# EAGLE design queencontroller2022 (EAGLE 9.6.2)

## Sheet 1 of 2
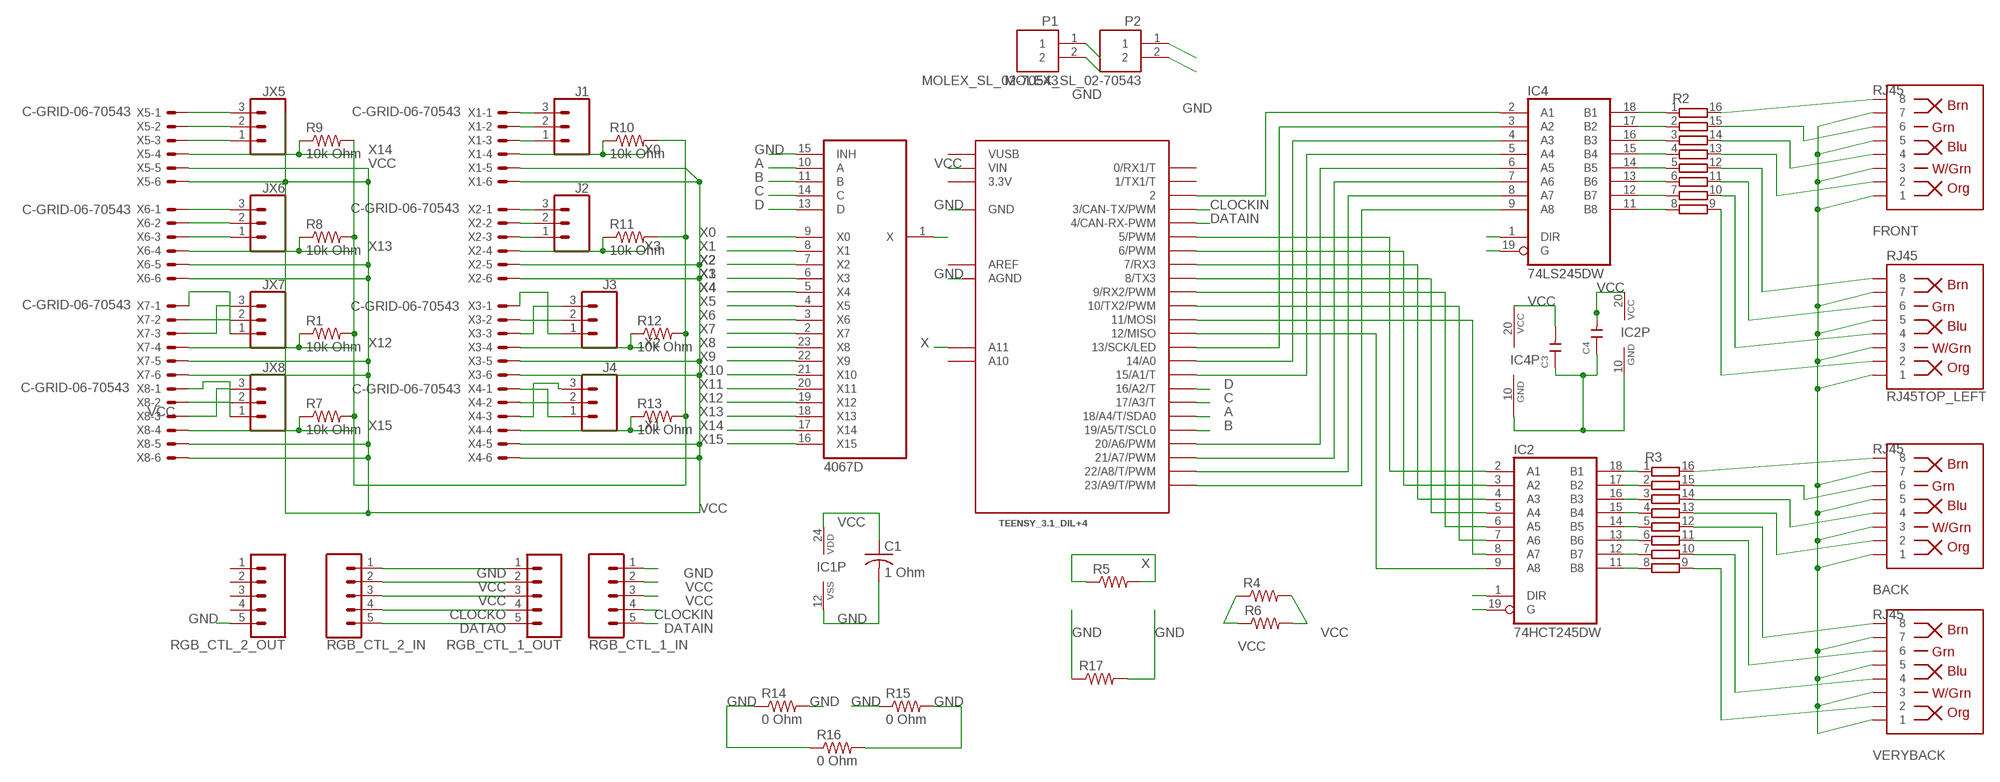
[diagram p0: schematic, sheet 1]

### Parts
BACK  RJ45  RJ45-8  [RJ45-8]
C1  1 Ohm  C-USC1206  [C1206]
C3  CAP-1206  [C1206]
C4  CAP-1206  [C1206]
FRONT  RJ45  RJ45-8  [RJ45-8]
IC1  4067D  [SO24W]
IC2  74HCT245DW  [SO20W]
IC4  74LS245DW  [SO20W]
J1  CONN_03  [1X03]
J2  CONN_03  [1X03]
J3  CONN_03  [1X03]
J4  CONN_03  [1X03]
JX5  CONN_03  [1X03]
JX6  CONN_03  [1X03]
JX7  CONN_03  [1X03]
JX8  CONN_03  [1X03]
P1  MOLEX_SL_02-70543  [SL_70543_2]
P2  MOLEX_SL_02-70543  [SL_70543_2]
R1  10k Ohm  R-US_M1206  [M1206]
R2  4816P-T01  [4816P]
R3  4816P-T01  [4816P]
R4  R-US_R2512  [R2512]
R5  R-US_R2512  [R2512]
R6  R-US_R2512  [R2512]
R7  10k Ohm  R-US_M1206  [M1206]
R8  10k Ohm  R-US_M1206  [M1206]
R9  10k Ohm  R-US_M1206  [M1206]
R10  10k Ohm  R-US_M1206  [M1206]
R11  10k Ohm  R-US_M1206  [M1206]
R12  10k Ohm  R-US_M1206  [M1206]
R13  10k Ohm  R-US_M1206  [M1206]
R14  0 Ohm  R-US_R2512  [R2512]
R15  0 Ohm  R-US_R2512  [R2512]
R16  0 Ohm  R-US_M1206  [M1206]
R17  R-US_R2512  [R2512]
RGB_CTL_1_IN  CONN_05  [1X05]
RGB_CTL_1_OUT  CONN_05  [1X05]
RGB_CTL_2_IN  CONN_05  [1X05]
RGB_CTL_2_OUT  CONN_05  [1X05]
RJ45TOP_LEFT  RJ45  RJ45-8  [RJ45-8]
U$3  TEENSY_3.1_DIL+4  [TEENSY3-DIL+4]
VERYBACK  RJ45  RJ45-8  [RJ45-8]
X1  C-GRID-06-70543  [70543-06]
X2  C-GRID-06-70543  [70543-06]
X3  C-GRID-06-70543  [70543-06]
X4  C-GRID-06-70543  [70543-06]
X5  C-GRID-06-70543  [70543-06]
X6  C-GRID-06-70543  [70543-06]
X7  C-GRID-06-70543  [70543-06]
X8  C-GRID-06-70543  [70543-06]

### Nets
A: IC1.10(A) U$3.18/A4(18/A4/T/SDA0)
B: IC1.11(B) U$3.19/A5(19/A5/T/SCL0)
C: IC1.14(C) U$3.17/A3(17/A3/T)
CLOCKIN: RGB_CTL_1_IN.4 U$3.3(3/CAN-TX/PWM)
CLOCKO: RGB_CTL_1_OUT.4 RGB_CTL_2_IN.4
D: IC1.13(D) U$3.16/A2(16/A2/T)
DATAIN: RGB_CTL_1_IN.5 U$3.4(4/CAN-RX-PWM)
DATAO: RGB_CTL_1_OUT.5 RGB_CTL_2_IN.5
GND [power]: BACK.1 BACK.3 BACK.5 BACK.7 C1.2 C3.1 C4.1 FRONT.1 FRONT.3 FRONT.5 FRONT.7 IC1.12(VSS) IC1.15(INH) IC2.10(GND) IC2.19(G) IC4.10(GND) IC4.19(G) P1.2 P2.2 R1.2 R7.2 R8.2 R9.2 R10.2 R11.2 R12.2 R13.2 R14.1 R14.2 R15.1 R15.2 R16.1 R16.2 R17.1 R17.2 RGB_CTL_1_IN.1 RGB_CTL_1_OUT.1 RGB_CTL_2_IN.1 RGB_CTL_2_OUT.5 RJ45TOP_LEFT.1 RJ45TOP_LEFT.3 RJ45TOP_LEFT.5 RJ45TOP_LEFT.7 U$3.AGND U$3.GND VERYBACK.1 VERYBACK.3 VERYBACK.5 VERYBACK.7
N$1: FRONT.8 R2.16
N$2: FRONT.6 R2.15
N$3: FRONT.4 R2.14
N$4: FRONT.2 R2.13
N$5: R2.10 RJ45TOP_LEFT.4
N$6: IC2.18(B1) R3.1
N$7: R2.12 RJ45TOP_LEFT.8
N$8: IC4.18(B1) R2.1
N$9: BACK.8 R3.16
N$10: BACK.6 R3.15
N$11: BACK.4 R3.14
N$12: BACK.2 R3.13
N$13: J3.3 X3.3
N$14: R3.11 VERYBACK.6
N$15: R3.10 VERYBACK.4
N$16: R3.9 VERYBACK.2
N$17: IC4.9(A8) U$3.23/A9(23/A9/T/PWM)
N$18: IC2.9(A8) U$3.12(12/MISO)
N$19: IC2.2(A1) U$3.5(5/PWM)
N$20: IC2.3(A2) U$3.6(6/PWM)
N$21: IC2.4(A3) U$3.7(7/RX3)
N$22: IC2.5(A4) U$3.8(8/TX3)
N$23: IC2.6(A5) U$3.9(9/RX2/PWM)
N$24: IC2.7(A6) U$3.10(10/TX2/PWM)
N$25: IC2.8(A7) U$3.11(11/MOSI)
N$26: IC4.8(A7) U$3.22/A8(22/A8/T/PWM)
N$27: IC4.7(A6) U$3.21/A7(21/A7/PWM)
N$28: IC4.6(A5) U$3.20/A6(20/A6/PWM)
N$29: IC4.5(A4) U$3.15/A1(15/A1/T)
N$30: IC4.4(A3) U$3.14/A0
N$31: IC4.3(A2) U$3.13(13/SCK/LED)
N$32: IC4.2(A1) U$3.2
N$33: IC4.17(B2) R2.2
N$34: IC4.16(B3) R2.3
N$35: IC4.15(B4) R2.4
N$36: IC4.14(B5) R2.5
N$37: IC4.13(B6) R2.6
N$38: IC4.12(B7) R2.7
N$39: IC4.11(B8) R2.8
N$40: R2.9 RJ45TOP_LEFT.2
N$41: IC2.17(B2) R3.2
N$42: IC2.16(B3) R3.3
N$43: IC2.15(B4) R3.4
N$44: IC2.14(B5) R3.5
N$45: IC2.13(B6) R3.6
N$46: IC2.12(B7) R3.7
N$47: IC2.11(B8) R3.8
N$48: J3.1 X3.1
N$49: JX5.3 X5.1
N$50: JX5.2 X5.2
N$51: JX5.1 X5.3
N$52: J4.1 X4.1
N$53: JX6.3 X6.1
N$54: JX6.2 X6.2
N$55: JX6.1 X6.3
N$56: JX7.3 X7.3
N$57: JX7.2 X7.2
N$58: JX7.1 X7.1
N$59: J4.3 X4.3
N$60: JX8.3 X8.3
N$61: JX8.2 X8.2
N$62: JX8.1 X8.1
N$68: R2.11 RJ45TOP_LEFT.6
N$69: R3.12 VERYBACK.8
N$71: J4.2 X4.2
N$76: J3.2 X3.2
N$78: J2.1 X2.3
N$79: J2.2 X2.2
N$81: J2.3 X2.1
N$82: J1.1 X1.3
N$83: J1.2 X1.2
N$84: J1.3 X1.1
VCC [power]: C1.1 C3.2 C4.2 IC1.24(VDD) IC2.1(DIR) IC2.20(VCC) IC4.1(DIR) IC4.20(VCC) P1.1 P2.1 R4.1 R4.2 R6.1 R6.2 RGB_CTL_1_IN.2 RGB_CTL_1_IN.3 RGB_CTL_1_OUT.2 RGB_CTL_1_OUT.3 RGB_CTL_2_IN.2 RGB_CTL_2_IN.3 U$3.VIN X1.5 X1.6 X2.5 X2.6 X3.5 X3.6 X4.5 X4.6 X5.5 X5.6 X6.5 X6.6 X7.5 X7.6 X8.5 X8.6
X: IC1.1(X) R5.1 R5.2 U$3.A11
X0: IC1.9(X0) R10.1 X1.4
X1: IC1.8(X1) R13.1 X4.4
X2: IC1.7(X2) R12.1 X3.4
X3: IC1.6(X3) R11.1 X2.4
X4: IC1.5(X4)
X5: IC1.4(X5)
X6: IC1.3(X6)
X7: IC1.2(X7)
X8: IC1.23(X8)
X9: IC1.22(X9)
X10: IC1.21(X10)
X11: IC1.20(X11)
X12: IC1.19(X12) R1.1 X7.4
X13: IC1.18(X13) R8.1 X6.4
X14: IC1.17(X14) R9.1 X5.4
X15: IC1.16(X15) R7.1 X8.4
Unconnected: RGB_CTL_2_OUT.1 RGB_CTL_2_OUT.2 RGB_CTL_2_OUT.3 RGB_CTL_2_OUT.4 U$3.0(0/RX1/T) U$3.1(1/TX1/T) U$3.A10

## Sheet 2 of 2

## Power pins joined to a net without a drawn wire
3.3V: U$3.3.3V
AREF: U$3.AREF
VUSB: U$3.VUSB

## Library data of the parts
BACK FRONT RJ45TOP_LEFT VERYBACK = SparkFun-Connectors:RJ45-8: RJ45 Jack - 8 pin Simple RJ45, 8-pin connection. Commonly used for Cat5, Cat5e, and Cat6 Ethernet cables. Here is the connector we sell at SparkFun: RJ45 8-Pin Connector <https://www.sparkfun.com/products/643> (PRT-00643) Datasheet <https://cdn.sparkfun.com/datasheets/Prototyping/04908.pdf> It is used on this SparkFun product: SparkFun RJ45 Breakout <https://www.sparkfun.com/products/716> (BOB-00716) Note, you may also be interested in the "MAGJACK" version of this. It is basically a RJ45 connector, but also has some status LEDs built into the connector housing. You can check that out in this library at the device named "MAGJACK.dev" and see these products online: RJ45 Ethernet MagJack-Compatible <https://www.sparkfun.com/products/8534> (PRT-08534) SparkFun RJ45 MagJack Breakout <https://www.sparkfun.com/products/13021> (BOB-13021); PROD_ID: CONN-08506; SF_ID: PRT-00643
C1 = resistor:C-US: CAPACITOR, American symbol
C3 C4 = OPL:CAP: Ceramic Capacitors
IC1 = 40xx:4067: 16-channel ANALOG MULTIPLEXER
IC2 = 74xx-eu:74*245: Octal BUS TRANSCEIVER, 3-state
IC4 = adafruit:74*245: Octal BUS TRANSCEIVER, 3-state
J1-J4 JX5-JX8 = SparkFun-Connectors:CONN_03: Multi connection point. Often used as Generic Header-pin footprint for 0.1 inch spaced/style header connections On any of the 0.1 inch spaced packages, you can populate with these: Break Away Headers - Straight <https://www.sparkfun.com/products/116> (PRT-00116) Break Away Male Headers - Right Angle <https://www.sparkfun.com/products/553> (PRT-00553) Female Headers <https://www.sparkfun.com/products/115> (PRT-00115) Break Away Headers - Machine Pin <https://www.sparkfun.com/products/117> (PRT-00117) Break Away Female Headers - Swiss Machine Pin <https://www.sparkfun.com/products/743> (PRT-00743) Stackable Header - 3 Pin (Female, 0.1") <https://www.sparkfun.com/products/13875> (PRT-13875) For SCREWTERMINALS and SPRING TERMINALS visit here: Screw Terimnals on SparkFun.com <https://www.sparkfun.com/search/results?term=Screw+Terminals> (5mm/3.5mm/2.54mm spacing) This device is also useful as a general connection point to wire up your design to another part of your project. Our various solder wires solder well into these plated through hole pads. Hook-Up Wire - Assortment (Stranded, 22 AWG) <https://www.sparkfun.com/products/11375> (PRT-11375) Hook-Up Wire - Assortment (Solid Core, 22 AWG) <https://www.sparkfun.com/products/11367> (PRT-11367) View the entire wire category on our website here <https://www.sparkfun.com/categories/141> Special notes: Molex polarized connector foot print use with SKU : PRT-08232 with associated crimp pins and housings.
P1 P2 = molex-sl-connectors_jw:MOLEX_SL_02: Molex SL-Series PCB Header, 2-Pos, 0.1" (2.54mm) Centers
R1 R7-R13 = rcl:R-US_: RESISTOR, American symbol; SPICEPREFIX: R
R2 R3 = resistor-bourns:4816P-T01: BOURNS RESISTOR NETWORK; MF: BOURNS, INC.; MPN: 4816P-T01-684LF; OC_FARNELL: 9357483; OC_NEWARK: 33K0707
R4-R6 R14 R15 R17 = resistor:R-US_: RESISTOR, American symbol
R16 = adafruit:R-US_: RESISTOR, American symbol
RGB_CTL_1_IN RGB_CTL_1_OUT RGB_CTL_2_IN RGB_CTL_2_OUT = SparkFun-Connectors:CONN_05: Multi connection point. Often used as Generic Header-pin footprint for 0.1 inch spaced/style header connections On any of the 0.1 inch spaced packages, you can populate with these: Break Away Headers - Straight <https://www.sparkfun.com/products/116> (PRT-00116) Break Away Male Headers - Right Angle <https://www.sparkfun.com/products/553> (PRT-00553) Female Headers <https://www.sparkfun.com/products/115> (PRT-00115) Break Away Headers - Machine Pin <https://www.sparkfun.com/products/117> (PRT-00117) Break Away Female Headers - Swiss Machine Pin <https://www.sparkfun.com/products/743> (PRT-00743) For SCREWTERMINALS and SPRING TERMINALS visit here: Screw Terimnals on SparkFun.com <https://www.sparkfun.com/search/results?term=Screw+Terminals> (5mm/3.5mm/2.54mm spacing) This device is also useful as a general connection point to wire up your design to another part of your project. Our various solder wires solder well into these plated through hole pads. Hook-Up Wire - Assortment (Stranded, 22 AWG) <https://www.sparkfun.com/products/11375> (PRT-11375) Hook-Up Wire - Assortment (Solid Core, 22 AWG) <https://www.sparkfun.com/products/11367> (PRT-11367) View the entire wire category on our website here <https://www.sparkfun.com/categories/141> Special notes: Molex polarized connector foot print use with SKU : PRT-08231 with associated crimp pins and housings. 1MM SMD Version SKU: PRT-10208
U$3 = Teensy_3_and_LC_Series_Boards_v1.1:TEENSY_3.1_DIL+4: Teensy 3.1 and 3.2 in a DIL package with the inner 4 pins
X1-X8 = con-molex:C-GRID-06: CONNECTOR wire to board 2.54 mm (0.100") pitch header; MF: MOLEX; OC_FARNELL: unknown; OC_NEWARK: unknown

## Net classes
1 power: width 0.001 mm

## Board
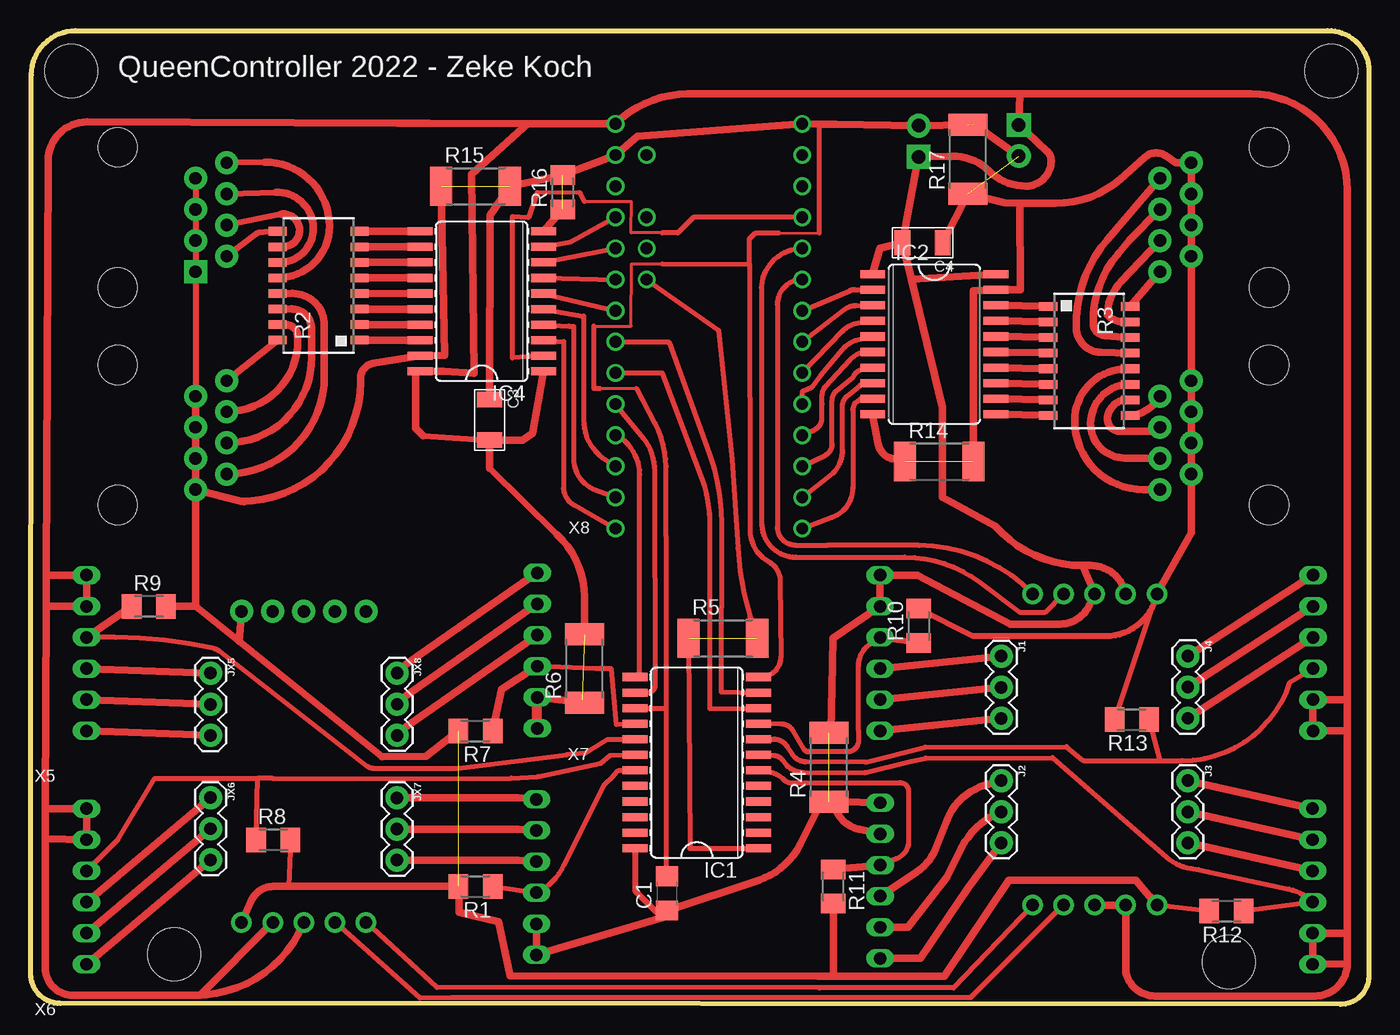
[diagram p1: board, top side]
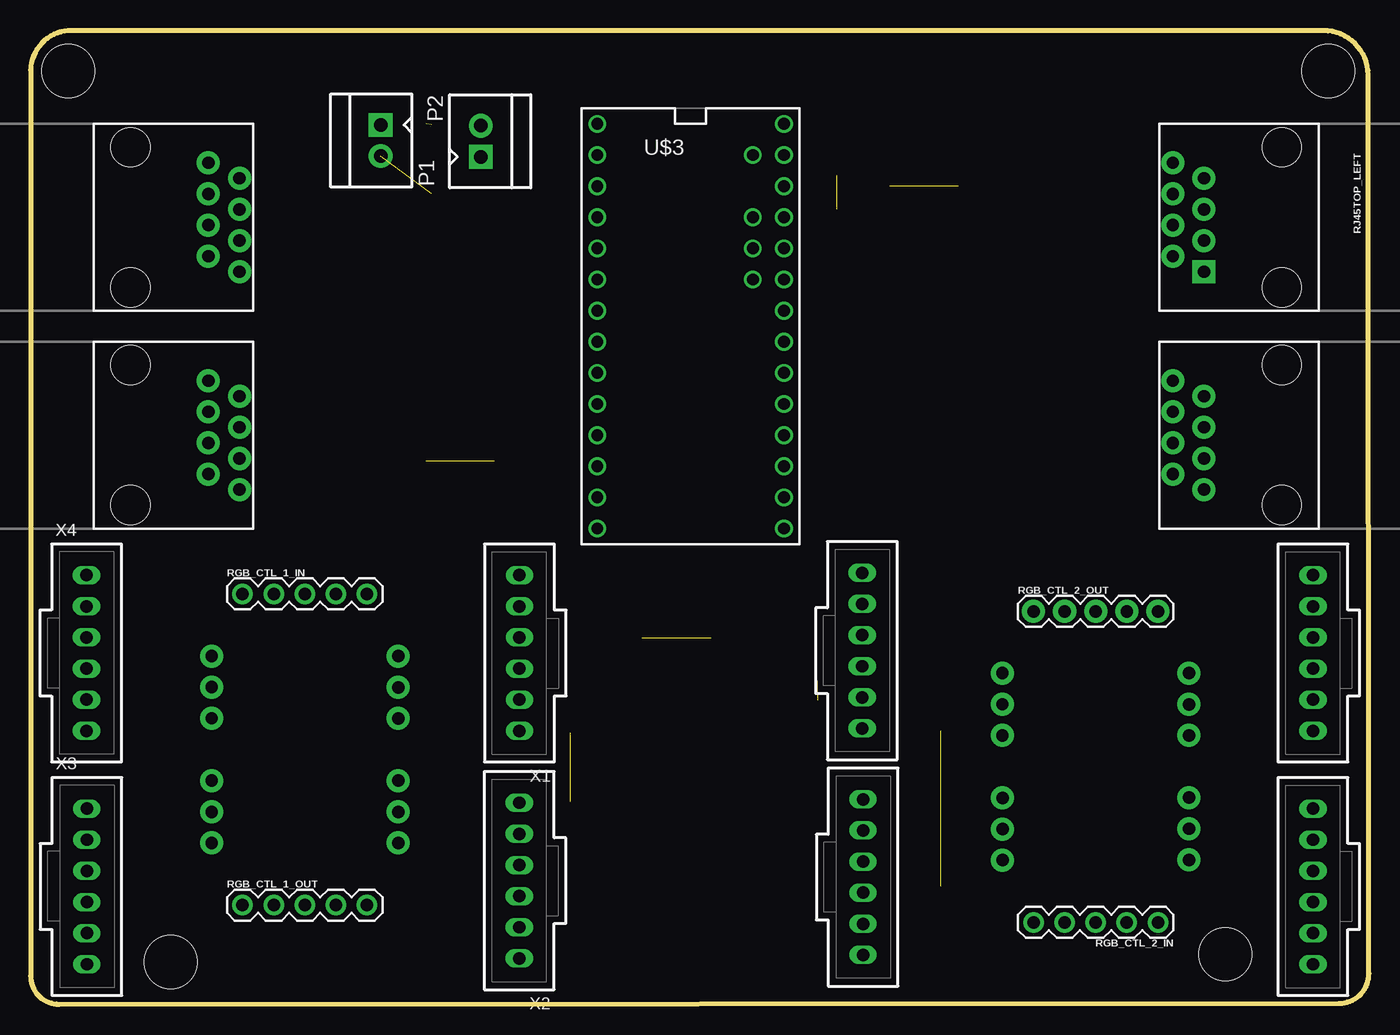
[diagram p2: board, bottom side, seen from below]

Size 109.25 x 79.46 mm. Coordinates in mm from the lower left corner, seen from the top.
Outline: 109.25,76.22 109.25,2.32 arc-90 106.93,0 2.43,0.07 arc-90 0,2.51 0.07,75.85 arc-90 3.68,79.46 105.87,79.46 arc-90 109.25,76.22
Copper layers (1*16): Top 0.035mm / dielectric 1.5mm / Bottom 0.035mm
Design rules "OthermillDRC_1_64_v2": minimum track width 16mil, minimum drill 31mil, track to track 0.39878125mm, track to pad 0.39878125mm, pad to pad 0.39878125mm, via to via 0.39878125mm, smd to smd 0mil, copper to edge 0mil, drill to drill 1mil, minimum pad ring 0mil, minimum via ring 15mil, stop-mask expansion 1mil, vias tented up to drill 30mil, thermal gap 10mil
Holes 4.32 mm at 3.3,76.16 106.17,76.16 97.81,3.45 11.73,4.07

### Footprints (pad centres in the part's own frame; a part is rotated, then mirrored left to right if it is on the bottom)
RJ45-8 = drill 1 pad 1.88: 1 -4.445,6.35; 2 -3.175,8.89; 3 -1.905,6.35; 4 -0.635,8.89; 5 0.635,6.35; 6 1.905,8.89; 7 3.175,6.35; 8 4.445,8.89 | hole 3.2: -5.715,0; 5.715,0
C1206 = smd 1.6 x 1.8: 1 -1.4,0; 2 1.4,0
C1206' = smd 1.27 x 2.032: 1 -1.651,0; 2 1.651,0
SO24W = smd 0.66 x 2.032: 1 -6.985,-5.029; 2 -5.715,-5.029; 3 -4.445,-5.029; 4 -3.175,-5.029; 5 -1.905,-5.029; 6 -0.635,-5.029; 7 0.635,-5.029; 8 1.905,-5.029; 9 3.175,-5.029; 10 4.445,-5.029; 11 5.715,-5.029; 12 6.985,-5.029; 13 6.985,5.029; 14 5.715,5.029; 15 4.445,5.029; 16 3.175,5.029; 17 1.905,5.029; 18 0.635,5.029; 19 -0.635,5.029; 20 -1.905,5.029; 21 -3.175,5.029; 22 -4.445,5.029; 23 -5.715,5.029; 24 -6.985,5.029
SO20W = smd 0.66 x 2.032: 1 -5.715,-5.029; 2 -4.445,-5.029; 3 -3.175,-5.029; 4 -1.905,-5.029; 5 -0.635,-5.029; 6 0.635,-5.029; 7 1.905,-5.029; 8 3.175,-5.029; 9 4.445,-5.029; 10 5.715,-5.029; 11 5.715,5.029; 12 4.445,5.029; 13 3.175,5.029; 14 1.905,5.029; 15 0.635,5.029; 16 -0.635,5.029; 17 -1.905,5.029; 18 -3.175,5.029; 19 -4.445,5.029; 20 -5.715,5.029
1X03 = drill 1.016 pad 1.88: 1 0,0; 2 2.54,0; 3 5.08,0
SL_70543_2 = drill 1.1 pad 1.93 square: 1 -1.27,1.27 | drill 1.1 pad 1.93: 2 1.27,1.27
M1206 = smd 1.6 x 2: 1 -1.4,0; 2 1.4,0
4816P = smd 0.7 x 1.5: 1 -4.445,-3.346; 2 -3.175,-3.346; 3 -1.905,-3.346; 4 -0.635,-3.346; 5 0.635,-3.346; 6 1.905,-3.346; 7 3.175,-3.346; 8 4.445,-3.346; 9 4.445,3.346; 10 3.175,3.346; 11 1.905,3.346; 12 0.635,3.346; 13 -0.635,3.346; 14 -1.905,3.346; 15 -3.175,3.346; 16 -4.445,3.346
R2512 = smd 1.8 x 3.2: 1 -2.8,0; 2 2.8,0
1X05 = drill 1.016 pad 1.676: 1 0,0; 2 2.54,0; 3 5.08,0; 4 7.62,0; 5 10.16,0
1X05' = drill 1.016 pad 1.88: 1 0,0; 2 2.54,0; 3 5.08,0; 4 7.62,0; 5 10.16,0
RJ45-8' = drill 1 pad 1.88 square: 1 -4.445,6.35 | drill 1 pad 1.88: 2 -3.175,8.89; 3 -1.905,6.35; 4 -0.635,8.89; 5 0.635,6.35; 6 1.905,8.89; 7 3.175,6.35; 8 4.445,8.89 | hole 3.2: -5.715,0; 5.715,0
TEENSY3-DIL+4 = drill 0.965: 0 -7.62,13.97; 1 -7.62,11.43; 2 -7.62,8.89; 3 -7.62,6.35; 3.3V 7.62,11.43; 4 -7.62,3.81; 5 -7.62,1.27; 6 -7.62,-1.27; 7 -7.62,-3.81; 8 -7.62,-6.35; 9 -7.62,-8.89; 10 -7.62,-11.43; 11 -7.62,-13.97; 12 -7.62,-16.51; 13 7.62,-16.51; 14/A0 7.62,-13.97; 15/A1 7.62,-11.43; 16/A2 7.62,-8.89; 17/A3 7.62,-6.35; 18/A4 7.62,-3.81; 19/A5 7.62,-1.27; 20/A6 7.62,1.27; 21/A7 7.62,3.81; 22/A8 7.62,6.35; 23/A9 7.62,8.89; A10 5.08,6.35; A11 5.08,3.81; AGND 7.62,13.97; AREF 5.08,8.89; GND -7.62,16.51; VIN 7.62,16.51; VUSB 5.08,13.97
70543-06 = drill 1.016 long: 1 -6.35,0; 2 -3.81,0; 3 -1.27,0; 4 1.27,0; 5 3.81,0; 6 6.35,0

### Placement (x,y rotation side)
BACK  101.09,64.23 270 bottom
C1  51.96,9.04 90 top
C3  [C1206']  37.45,47.69 270 top
C4  [C1206']  72.82,62.16 180 top
FRONT  7.11,46.45 90 bottom
IC1  54.39,19.72 90 top
IC2  73.77,53.86 270 top
IC4  36.83,57.37 90 top
J1  79.24,28.41 270 top
J2  79.24,18.25 270 top
J3  94.47,18.25 270 top
J4  94.47,28.42 270 top
JX5  14.69,27.02 270 top
JX6  14.69,16.86 270 top
JX7  29.91,16.84 270 top
JX8  29.92,27.02 270 top
P1  71.22,70.43 90 bottom
P2  81.94,70.49 270 bottom
R1  36.32,9.62 180 top
R2  23.52,58.64 90 top
R3  86.41,52.5 270 top
R4  65.17,19.34 90 top
R5  56.52,29.87 0 top
R6  45.21,27.4 90 top
R7  36.32,22.32 180 top
R8  19.81,13.43 0 top
R9  9.65,32.48 0 top
R10  72.51,30.89 90 top
R11  65.53,9.62 270 top
R12  97.62,7.6 180 top
R13  89.89,23.23 180 top
R14  74.18,44.3 0 top
R15  36.32,66.77 0 top
R16  43.42,66.26 90 top
R17  76.52,68.96 90 top
RGB_CTL_1_IN  91.95,33.49 0 bottom
RGB_CTL_1_OUT  91.95,8.09 0 bottom
RGB_CTL_2_IN  17.22,6.68 180 bottom
RGB_CTL_2_OUT  [1X05']  27.38,32.07 0 bottom
RJ45TOP_LEFT  RJ45  [RJ45-8']  7.11,64.23 90 bottom
U$3  55.37,55.34 0 bottom
VERYBACK  101.09,46.45 270 bottom
X1  69.34,28.67 90 bottom
X2  69.37,10.1 90 bottom
X3  104.66,9.62 270 bottom
X4  104.69,28.67 270 bottom
X5  4.57,28.67 90 bottom
X6  4.57,9.62 90 bottom
X7  41.3,10.37 270 bottom
X8  41.36,28.86 270 bottom

### Tracks (layer width: path | path; a pad name or v marks a point on that pad's centre or on a via)
A
  Top 0.406: U$3.18/A4 51.56,51.53 54.69,43.19 arc-21 55.43,39.13 55.43,24.12 IC1.10
B
  Top 0.406: IC1.11 56.38,25.5 56.41,39.16 arc20 55.41,44.89 52.1,54.05 U$3.19/A5
C
  Top 0.406: IC1.14 49.39,25.44 50.31,25.41 arc92 50.99,26.07 50.97,43.53 arc39 50.02,46.18 U$3.17/A3
CLOCKIN
  Top 0.406: RGB_CTL_1_IN.4 82.8,31.96 80.8,31.96 77.51,34.43 arc37 71.36,36.48 62.47,36.48 arc-90 59.68,39.28 59.68,58.37 arc-90 U$3.3
CLOCKO
  Top 0.406: RGB_CTL_1_OUT.4 84.29,8.09 76.74,0.54 75.35,0.54 75.02,0.53 75.01,0.54 59.07,0.54 59.06,0.54 34.37,0.54 31.78,0.5 RGB_CTL_2_IN.4
D
  Top 0.406: U$3.16/A2 arc-63 49.72,43.25 49.72,26.9 IC1.13
DATAIN
  Top 0.406: U$3.4 arc90 60.95,57.11 60.95,38.95 arc90 62.43,37.48 65.07,37.47 65.08,37.47 72.53,37.44 arc-46 RGB_CTL_1_IN.5
DATAO
  Top 0.406: RGB_CTL_1_OUT.5 75.34,1.35 64.42,1.35 64.36,1.35 33.15,1.37 RGB_CTL_2_IN.5
GND  (6 unrouted)
  Top 0.254: 61.07,62.95 64.4,62.93 | 46.48,50.26 49.46,50.26 | 45.96,55.34 49.02,55.34 49.04,60.42 51.56,60.42
  Top 0.406: 91.92,8.12 | 91.92,8.12 91.93,8.11 RGB_CTL_1_OUT.1 R12.2 | IC1.12 59.62,26.71 arc90 61.23,28.35 61.19,34.54 arc61 60.22,36.15 arc-61 58.73,38.66 58.68,60.39 | 58.68,60.42 58.68,60.41 | 58.68,60.41 58.68,60.39 | 64.4,62.93 64.4,71.82 | IC1.15 51.87,24.17 | 51.87,24.17 51.89,38.18 51.87,43.87 arc28 50.99,47.39 49.46,50.26 | 45.96,55.34 45.96,50.26 46.48,50.26 | 51.56,60.42 58.68,60.39 | 51.87,24.17 51.87,10.54 C1.2 | R8.2 21.08,9.62 | R13.2 RGB_CTL_1_IN.1 | 58.68,60.41 58.68,62.45 59.18,62.96 61.07,62.96 61.07,62.95
  Top 0.508: 91.84,33.14 arc-74 87.73,30.03 76.96,30.03 R10.2 | RJ45TOP_LEFT.7 RJ45TOP_LEFT.5 RJ45TOP_LEFT.3 RJ45TOP_LEFT.1 FRONT.7
  Top 0.61: FRONT.7 FRONT.5 FRONT.3 FRONT.1 | 17.19,41.07 arc90 26.92,50.78 26.92,51.09 arc-81 27.94,52.29 IC4.19 33.79,52.96 R15.1 | 91.92,33.71 RGB_CTL_1_IN.1 | 91.42,8.77 RGB_CTL_1_OUT.1 90.24,10.11 79.85,10.13 74.61,2.28 65.53,2.28 | FRONT.1 17.19,41.07 | 17.19,41.07 17.43,41.01 | 13.46,32.48 FRONT.1 | RGB_CTL_1_IN.1 91.84,33.14 | RGB_CTL_2_IN.1 18.02,8.46 arc-66 19.81,9.62 21.08,9.62 R1.2 34.98,7.5 38.22,6.74 39.13,2.33 64.26,2.28 65.53,2.28 | 17.01,29.62 28.7,20.21 32.27,20.24 R7.2 | 17.01,29.62 13.46,32.48 | P1.2 65.74,71.8 64.4,71.82 U$3.GND 49.53,70.83 U$3.AGND R16.2 R15.2 37.52,64.4 C3.1 | 80.77,65.38 83.67,65.36 arc42 88.95,67.34 90.97,69.13 arc-76 92.68,69.23 93.49,68.67 BACK.1 BACK.3 BACK.5 BACK.7 VERYBACK.1 VERYBACK.3 VERYBACK.5 VERYBACK.7 94.74,38.48 RGB_CTL_1_IN.1 | 73.15,71.71 P1.2 | P2.2 76.96,71.85 | R9.2 13.46,32.48 | R11.2 65.53,2.28 | 17.01,29.62 RGB_CTL_2_OUT.5 | R17.2 P1.2 | 80.77,65.38 79.47,65.39 R17.1 C4.1 | 80.77,65.38 80.78,58.33 IC2.19 76.95,58.21 R14.2 | IC2.10 69.16,45.8 arc68 70.41,44.5 R14.1 | IC4.10 R16.1
N$1
  Top 0.61: R2.16 FRONT.8
N$2
  Top 0.61: R2.15 20.8,55.47 arc-90 21.81,54.46 21.81,54.17 arc-90 FRONT.6
N$3
  Top 0.61: R2.14 21.3,56.74 arc-90 22.94,55.12 22.95,52.79 arc-90 FRONT.4
N$4
  Top 0.61: R2.13 21.4,58.01 arc-90 23.98,55.43 23.98,51.25 arc-90 FRONT.2
N$5
  Top 0.508: 20.46,64.49 RJ45TOP_LEFT.4
  Top 0.61: R2.10 20.67,61.83 arc90 21.95,63.2 arc95 20.46,64.49
N$6
  Top 0.61: R3.1 83.04,56.96 IC2.18
N$7
  Top 0.508: 19.11,68.72 RJ45TOP_LEFT.8
  Top 0.61: R2.12 arc90 24.39,63.48 arc91 19.11,68.72
N$8
  Top 0.61: R2.1 IC4.18 arc-45 IC4.18
N$9
  Top 0.61: BACK.8 R3.16
N$10
  Top 0.61: BACK.6 89.01,58.96 arc43 87.9,56.26 arc44 89.29,55.68 R3.15
N$11
  Top 0.61: BACK.4 89.7,62.37 88.74,61.22 arc41 86.74,55.58 arc85 87.69,54.57 R3.14
N$12
  Top 0.61: R3.13 87.34,53.2 arc-87 85.37,55.17 arc-42 87.92,62.41 BACK.2
N$13
  Top 0.61: X3.3 J3.3
N$14
  Top 0.61: R3.11 arc90 86.53,47.4 arc90 89.33,44.57 VERYBACK.6
N$15
  Top 0.61: R3.10 89.48,49.32 arc89 87.91,47.75 arc91 88.88,46.77 91.44,46.77 arc45 VERYBACK.4
N$16
  Top 0.61: R3.9 arc50 91.85,49.16 VERYBACK.2
N$17
  Top 0.406: IC4.9 44.14,62.24 U$3.23/A9
N$18
  Top 0.406: U$3.12 65.44,39.74 arc70 67.11,42.14 67.11,48.55 67.29,49.07 67.73,49.4 IC2.9
N$19
  Top 0.406: U$3.5 66.87,58.25 arc-24 67.27,58.33 IC2.2
N$20
  Top 0.406: U$3.6 66.39,56.67 arc-37 67.38,57.02 IC2.3
N$21
  Top 0.406: U$3.7 66.25,54.92 arc-38 67.58,55.6 IC2.4
N$22
  Top 0.406: U$3.8 63.01,50.05 63.84,50.41 64.52,51.33 66.26,53.42 arc-30 67.34,54.17 IC2.5
N$23
  Top 0.406: U$3.9 64,46.9 arc65 64.59,47.8 64.6,48.98 64.61,49.71 arc-42 64.87,50.38 66.87,52.58 arc-37 68.09,53.25 IC2.6
N$24
  Top 0.406: U$3.10 64.87,44.81 arc64 65.44,45.71 65.44,49.31 arc-50 65.8,50.08 67.14,51.18 arc-58 67.92,51.82 IC2.7
N$25
  Top 0.406: U$3.11 65.31,43.18 arc52 66.29,45.21 66.29,48.99 arc-44 66.64,49.6 67.73,50.52 IC2.8
N$26
  Top 0.406: IC4.8 U$3.22/A8
N$27
  Top 0.406: IC4.7 U$3.21/A7
N$28
  Top 0.406: IC4.6 U$3.20/A6
N$29
  Top 0.406: IC4.5 45.14,56.16 45.14,47.68 arc58 46.96,44.4 U$3.15/A1
N$30
  Top 0.406: IC4.4 43.94,55.34 44.33,55.31 44.33,44.52 arc70 46.09,41.98 U$3.14/A0
N$31
  Top 0.406: IC4.3 43.52,54.08 43.49,42.1 arc55 44.35,40.75 U$3.13
N$32
  Top 0.254: 51.56,62.96 49.02,62.94 49.05,65.5 45.21,65.47
  Top 0.356: 45.21,65.47 44.79,66.26 41.34,66.23
  Top 0.406: IC4.2 39.32,52.76 39.32,64.27 40.64,64.19 41.34,66.23 | 51.56,62.96 52.83,62.96 54.1,64.23 U$3.2
N$33
  Top 0.61: IC4.17 R2.2
N$34
  Top 0.61: IC4.16 R2.3
N$35
  Top 0.61: IC4.15 R2.4
N$36
  Top 0.61: IC4.14 R2.5
N$37
  Top 0.61: IC4.13 R2.6
N$38
  Top 0.61: IC4.12 R2.7
N$39
  Top 0.61: IC4.11 R2.8
N$40
  Top 0.508: R2.9 18.54,62.96 RJ45TOP_LEFT.2
N$41
  Top 0.61: R3.2 83.04,55.69 IC2.17
N$42
  Top 0.61: R3.3 83.04,54.42 IC2.16
N$43
  Top 0.61: R3.4 83.04,53.15 IC2.15
N$44
  Top 0.61: R3.5 83.04,51.88 IC2.14
N$45
  Top 0.61: R3.6 83.04,50.61 IC2.13
N$46
  Top 0.61: R3.7 83.04,49.34 IC2.12
N$47
  Top 0.61: R3.8 83.04,48.07 IC2.11
N$48
  Top 0.61: X3.1 J3.1
N$49
  Top 0.61: JX5.3 X5.1
N$50
  Top 0.61: JX5.2 X5.2
N$51
  Top 0.61: X5.3 JX5.1
N$52
  Top 0.61: J4.1 X4.1
N$53
  Top 0.61: X6.1 JX6.3
N$54
  Top 0.61: X6.2 JX6.2
N$55
  Top 0.61: X6.3 JX6.1
N$56
  Top 0.61: X7.3 39.79,11.76 JX7.3
N$57
  Top 0.61: X7.2 39.79,14.3 JX7.2
N$58
  Top 0.61: X7.1 39.79,16.84 JX7.1
N$59
  Top 0.61: J4.3 X4.3
N$60
  Top 0.61: JX8.3 30.63,22.66 X8.3
N$61
  Top 0.61: JX8.2 30.63,25.2 X8.2
N$62
  Top 0.61: JX8.1 30.63,27.74 X8.1
N$68
  Top 0.508: RJ45TOP_LEFT.6 20.03,66.26
  Top 0.61: R2.11 20.27,60.54 arc92 23.08,63.34 arc91 20.03,66.26
N$69
  Top 0.61: VERYBACK.8 90.85,42 arc-90 85.23,47.6 arc-90 89.51,51.86 R3.12
N$71
  Top 0.61: J4.2 X4.2
N$76
  Top 0.61: X3.2 J3.2
N$78
  Top 0.61: X2.3 72.37,10.83 arc35 73.86,12.67 74.83,15.09 arc-52 77.91,17.87 J2.1
N$79
  Top 0.61: J2.2 78.92,15.57 arc39 76,12.77 74.79,10.35 71.62,6.3 X2.2
N$81
  Top 0.61: J2.3 76.51,9.46 72.66,3.77 X2.1
N$82
  Top 0.61: X1.3 J1.1
N$83
  Top 0.61: X1.2 J1.2
N$84
  Top 0.61: X1.1 J1.3
VCC  (2 unrouted)
  Top 0.508: 32.05,46.38 C3.2 | IC4.20 31.42,51.67 | IC1.24 49.36,9.28 51.56,7.08 51.96,7.48 C1.1 | 42.98,38.31 37.45,43.76
  Top 0.61: 31.42,51.53 31.5,51.53 | 31.42,51.67 31.42,51.53 | 31.42,51.53 31.42,47.01 32.05,46.38 | 78.76,59.55 IC2.20 71.9,59.15 | 1.28,35.01 1.42,68.83 arc-90 4.6,72 29.97,71.91 31.24,71.91 32.51,71.9 40.57,71.87 | 1.28,35.01 1.27,32.47 | 1.27,32.47 1.2,15.96 | 1.2,15.96 1.2,15.51 1.2,13.49 | 80.77,74.29 53.64,74.29 arc45 U$3.VIN 42.67,71.86 41.92,71.87 40.57,71.87 | 80.77,74.29 99.62,74.3 arc-90 107.48,66.44 107.48,24.86 | 40.57,71.87 35.98,67.72 36.18,51.49 33.71,51.65 IC4.20 | 13.46,0.75 13.83,0.75 RGB_CTL_2_IN.2 20.05,7.04 | 13.46,0.75 3.43,0.75 arc-90 1.2,2.98 1.2,13.49 | RGB_CTL_1_IN.2 arc77 86.5,35.81 85.85,35.81 | 85.85,35.81 arc-48 78.77,39 74.42,41.37 74.43,48.72 71.9,59.15 | 85.85,35.81 RGB_CTL_1_IN.3 86.42,32.55 arc-64 84.01,31.03 79.97,31.01 72.41,35.02 X1.6 X1.5 65.48,29.89 65.45,27.81 65.44,27.68 65.35,22.32 R4.2 | 107.48,24.86 107.48,22.32 | 107.48,22.32 107.48,5.81 | 107.48,5.81 107.48,3.32 | 107.48,3.32 arc-90 104.83,0.67 91.82,0.67 arc-76 89.41,2.56 RGB_CTL_1_OUT.2 RGB_CTL_1_OUT.3 | RGB_CTL_2_IN.3 22.26,6.58 arc-67 13.46,0.75 | 65.53,16.54 66.03,16.54 X2.6 | 65.53,16.54 R4.1 | R6.2 45.21,33.27 arc48 42.98,38.31 | 80.77,74.29 P2.1 82.96,69.63 arc-47 83.31,68.83 arc-90 81.25,66.77 arc-45 78.25,67.99 arc45 75.22,69.2 P1.1 C4.2 | C1.1 59.45,10.13 arc45 62.79,13.02 64.26,15.97 65.53,16.54 | IC4.1 40.99,46.6 40.15,46.04 C3.2 37.45,43.76 | 71.9,59.15 C4.2 | IC2.1 69.34,61.69 C4.2 | 1.2,13.49 X6.5 X6.6 1.2,15.96 | 1.28,35.01 X5.6 X5.5 1.27,32.47 | 107.48,5.81 X3.5 X3.6 107.48,3.32 | 107.48,22.32 X4.6 X4.5 107.48,24.86 | X2.5 67.68,14.26 arc-68 65.54,16.48 65.53,16.54 | 51.56,7.08 X7.6 X7.5
  Top 0.61: R6.1 X8.5
  Top 0.813: X8.6 X8.5 | 45.01,24.8 R6.1
X  (1 unrouted)
  Top 0.406: R5.1 53.81,12.72 IC1.1 | U$3.A11 56.16,55 57.28,44.47 57.73,37.23 arc17 R5.2
X0
  Top 0.406: X1.4 68.53,29.4 arc56 67.59,27.64 67.59,22.32 67.59,21.54 arc-91 66.66,20.6 63.49,20.61 arc-60 63.12,20.82 62.25,22.31 arc59 61.29,22.87 59.68,22.9 IC1.9
  Top 0.508: X1.4 R10.1
X1
  Top 0.406: IC1.8 60.66,21.64 arc-57 61.74,21.06 62.19,20.39 arc56 63.29,19.78 68.14,19.76 73.01,20.99 84.56,21.02 85.94,19.88 92.2,19.88 | 92.2,19.88 93.99,19.88 arc72 102.81,26.28 X4.4 | R13.1 92.2,19.88
X2
  Top 0.406: IC1.7 60.61,20.32 arc-50 61.37,19.94 61.6,19.65 arc51 63.12,18.92 68.07,18.91 71.87,19.82 73.07,20.1 83.44,20.13 92.74,12.01 arc32 94.73,11.08 95.36,10.99 102.75,9.39 arc-33 X3.4 R12.1
X3
  Top 0.406: IC1.6 60.05,19.01 arc-38 61.54,18.29 arc45 62.1,18.06 67.78,18.06 70.97,18.08 arc-90 71.68,17.38 71.68,13.33 arc-69 70.68,11.87 X2.4
  Top 0.61: R11.1 X2.4
X12
  Top 0.406: IC1.19 48,19.09 47.58,18.67 46.82,17.91 43.54,11.35 arc-37 X7.4 R1.1
X13
  Top 0.406: IC1.18 47.32,20.31 46.54,19.66 41.39,18.59 39.23,18.47 19.81,18.41 19.77,18.44 18.54,18.44 | 18.54,18.44 10.15,18.43 7.11,13.43 X6.4 | R8.1 18.54,18.44
X14
  Top 0.406: X5.4 6.92,29.94 arc-13 14.9,29.06 arc-25 15.45,28.8 27.53,19.4 arc38 27.94,19.26 34.94,19.26 43.79,20.37 45.25,20.47 47.11,21.61 IC1.17
  Top 0.61: R9.1 X5.4
X15
  Top 0.406: X8.4 46.13,27.4 47.41,27.37 47.83,22.83 IC1.16
  Top 0.61: X8.4 38.45,25.71 R7.1

### Text on the board
tPlace: QueenController 2022 - Zeke Koch